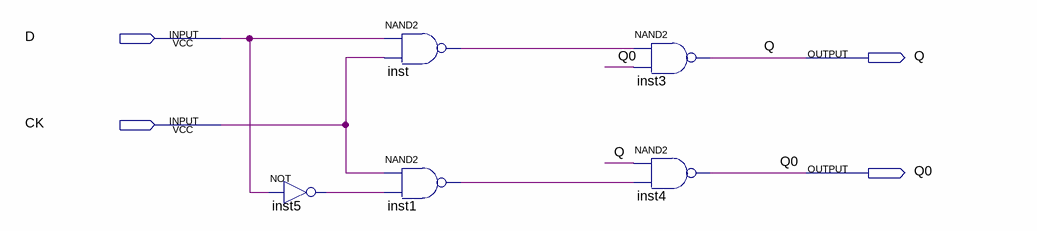
[diagram p0: schematic sheet]
// Quartus schematic FPGA_D_Clock_Latch.bdf as structural Verilog: 5 symbols, 4 pins
module FPGA_D_Clock_Latch (
  input  D,
  input  CK,
  output Q,
  output Q0
);

  wire inst1_out, inst5_out, inst_out;

  not inst5 (inst5_out, D);
  nand inst (inst_out, D, CK);
  nand inst1 (inst1_out, CK, inst5_out);
  nand inst3 (Q, inst_out, Q0);
  nand inst4 (Q0, Q, inst1_out);
endmodule
